# Altium schematic sheet S_Band.SchDoc
size A2; SheetNumber: 9; SheetTotal: 11
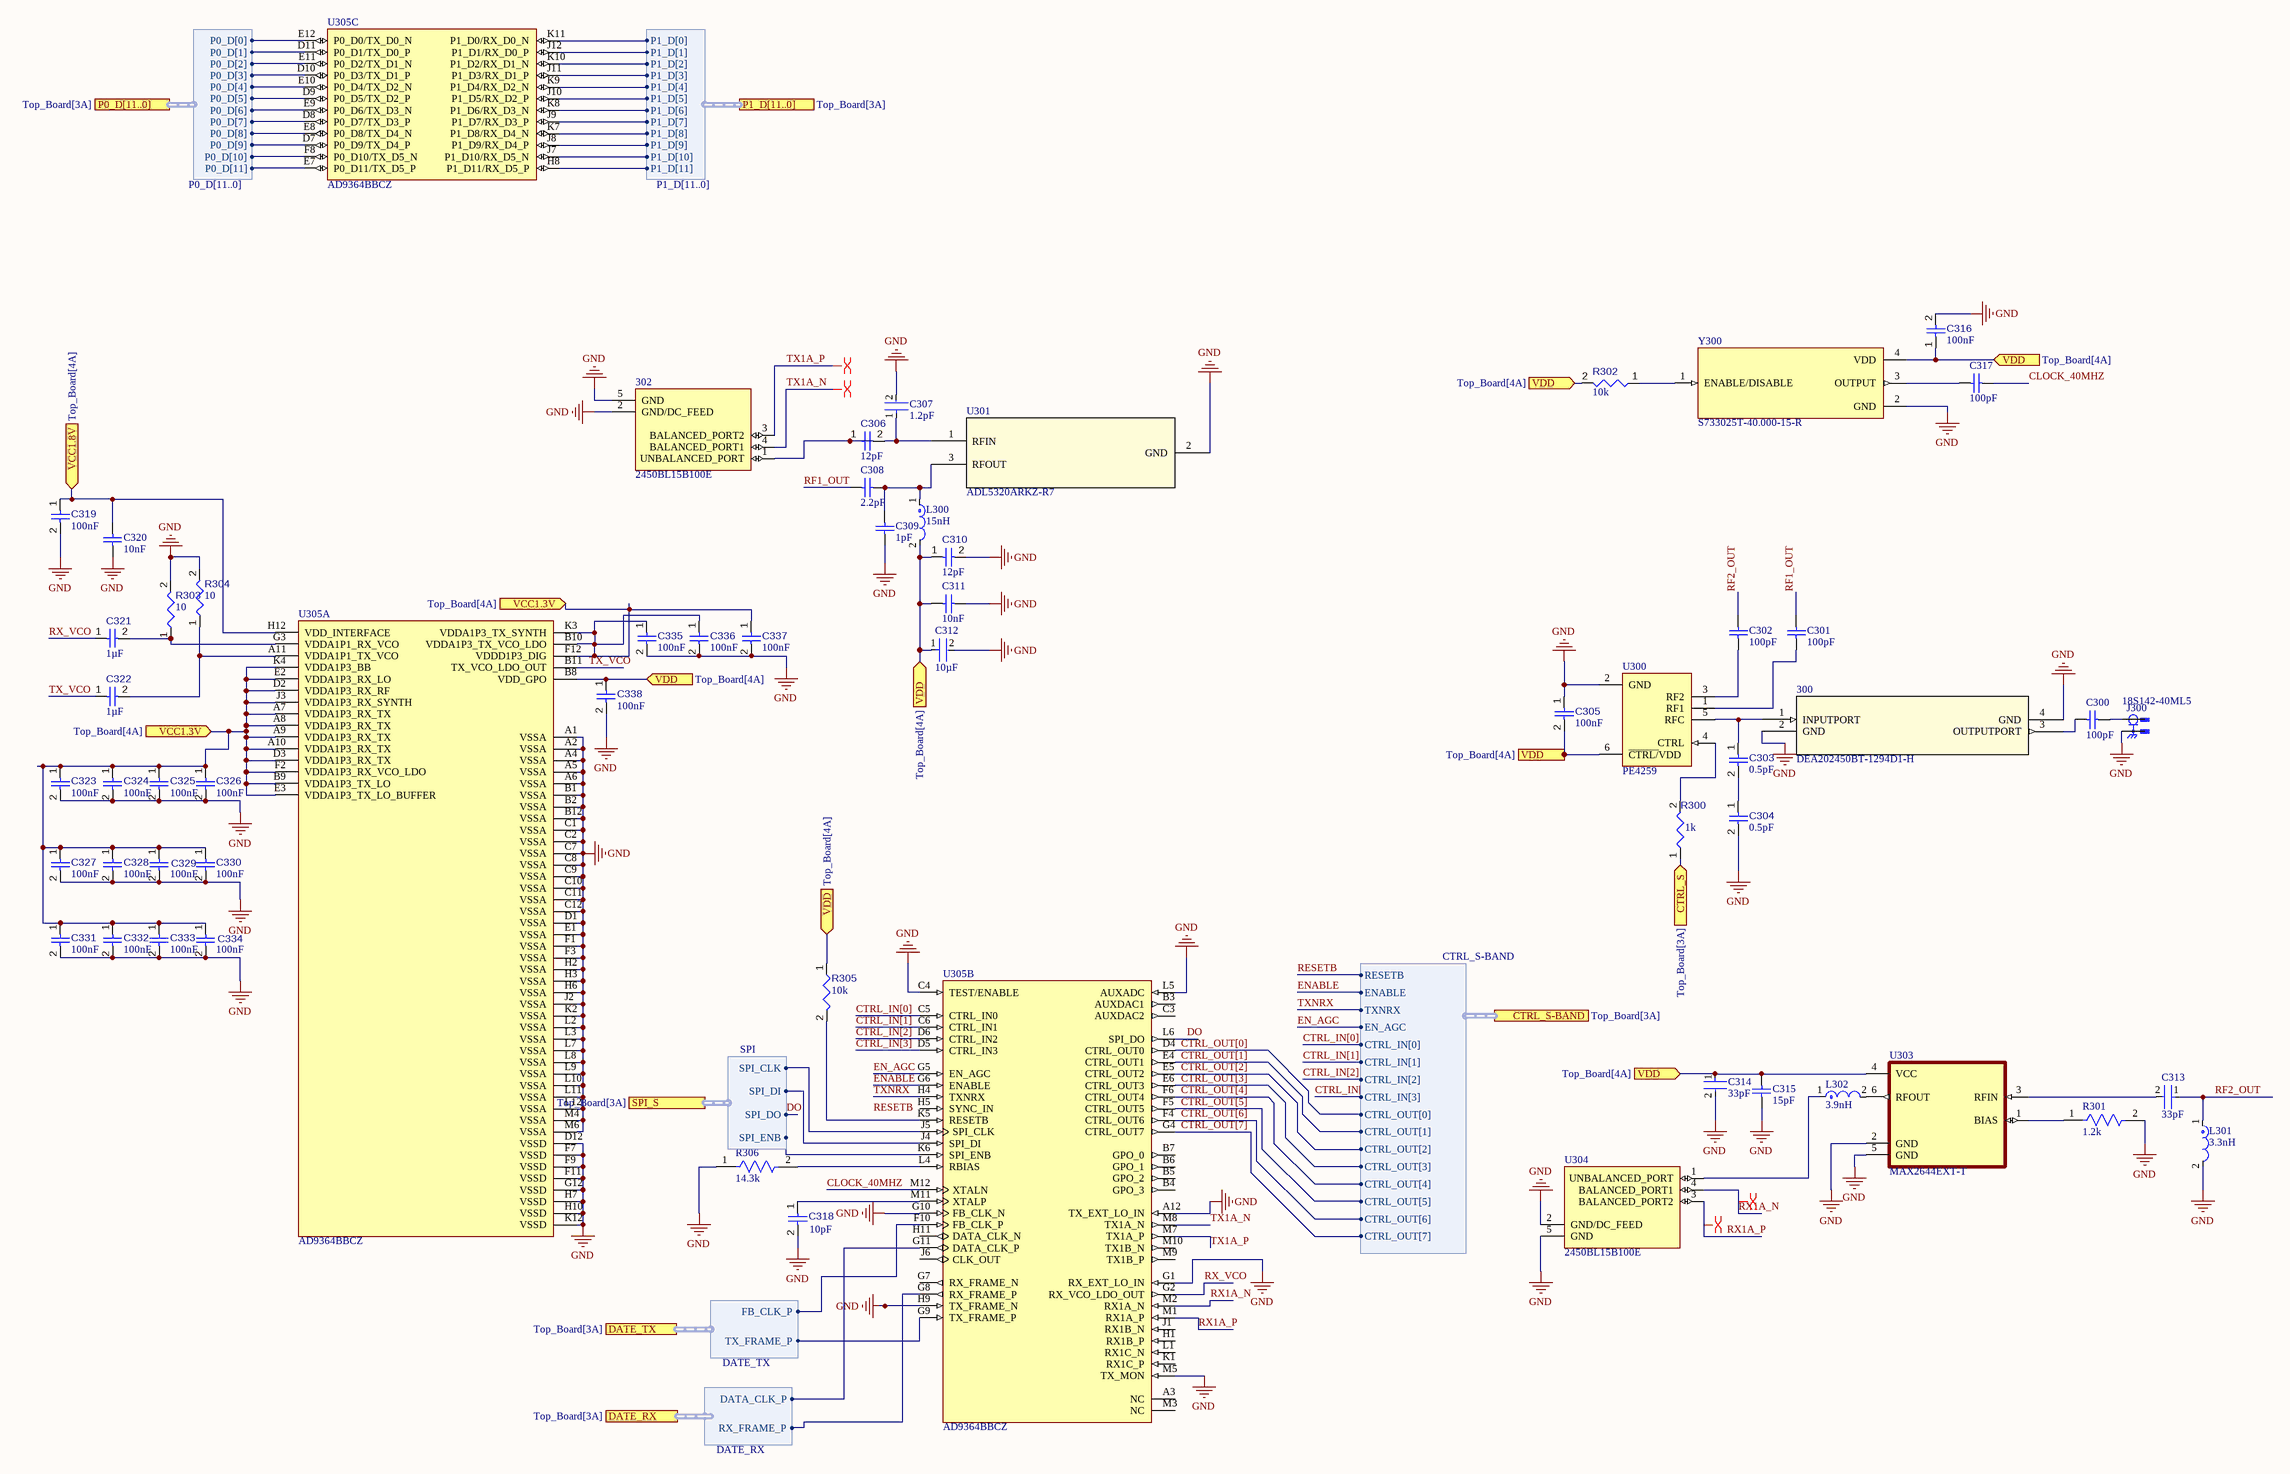
[diagram p0: S_Band.SchDoc]

## Parts
300  DEA202450BT-1294D1-H  [SMD4_DEA202450BT-0805_TDK]
302  2450BL15B100E  [BALUN_2450BL15B100E]
C300  value 100pF  [CAPC1608X92X38LL15T08]  (hidden comment: cap 100pF 0603)
C301  value 100pF  [CAPC1005X60X26ML10T16]  (hidden comment: cap 100p)
C302  value 100pF  [CAPC1005X60X26ML10T16]  (hidden comment: cap 100p)
C303  value 0.5pF  [CAPC1005X56X25ML10T15]  (hidden comment: Capacitor 0.5 pF +/- 0.1pF 25 V 0402)
C304  value 0.5pF  [CAPC1005X56X25ML10T15]  (hidden comment: Capacitor 0.5 pF +/- 0.1pF 25 V 0402)
C305  value 100nF  [CAPC0402(1005)60_L]  (hidden comment: Capacitor 100nF +/-20% 50V 0402)
C306  value 12pF  [CAPC0402(1005)33_L]  (hidden comment: Capacitor 12pF +/-10% 50V 0402)
C307  value 1.2pF  [FP-C0603C-CF-IPC_B]  (hidden comment: cap 1.2pF 0603)
C308  value 2.2pF  [CAPC0603(1608)100_N]  (hidden comment: cap 2.2pF 0603)
C309  value 1pF  [CAPC1608X92X38LL15T08]  (hidden comment: cap 1pF 0603)
C310  value 12pF  [CAPC0402(1005)33_L]  (hidden comment: Capacitor 12pF +/-10% 50V 0402)
C311  value 10nF  [CAPC1608X92X38LL15T08]  (hidden comment: cap 10nF 0603)
C312  value 10µF  [FP-CC0603-DC-IPC_B]  (hidden comment: cap 10uF 0603)
C313  value 33pF  [FP-C0603C-CF-IPC_B]  (hidden comment: cap 33pF 0603)
C314  value 33pF  [FP-C0603C-CF-IPC_B]  (hidden comment: cap 33pF 0603)
C315  value 15pF  [CAPC1608X92X38LL15T08]  (hidden comment: cap 15pF 0603)
C316  value 100nF  [CAPC2013X95X50LL10T25]  (hidden comment: Capacitor 100 nF +/-10% 50 V 0805)
C317  value 100pF  [CAPC1608X92X38LL15T08]  (hidden comment: cap 100pF 0603)
C318  value 10pF  [CAPC1608X90X40ML10T20]  (hidden comment: Capacitor 10 pF +/- 5% 50 V 0603)
C319  value 100nF  [CAPC1608X90X40NL10T20]  (hidden comment: Capacitor 100 nF +/-10% 50 V 0603)
C320  value 10nF  [CAPC1608X92X38LL15T08]  (hidden comment: cap 10nF 0603)
C321  value 1µF  [CAPC1608X90X35ML15T15]  (hidden comment: Capacitor 1uF +/- 10% 16V 0603)
C322  value 1µF  [CAPC1608X90X35ML15T15]  (hidden comment: Capacitor 1uF +/- 10% 16V 0603)
C323  value 100nF  [CAPC1608X90X40NL10T20]  (hidden comment: Capacitor 100 nF +/-10% 50 V 0603)
C324  value 100nF  [CAPC1608X90X40NL10T20]  (hidden comment: Capacitor 100 nF +/-10% 50 V 0603)
C325  value 100nF  [CAPC1608X90X40NL10T20]  (hidden comment: Capacitor 100 nF +/-10% 50 V 0603)
C326  value 100nF  [CAPC1608X90X40NL10T20]  (hidden comment: Capacitor 100 nF +/-10% 50 V 0603)
C327  value 100nF  [CAPC1608X90X40NL10T20]  (hidden comment: Capacitor 100 nF +/-10% 50 V 0603)
C328  value 100nF  [CAPC1608X90X40NL10T20]  (hidden comment: Capacitor 100 nF +/-10% 50 V 0603)
C329  value 100nF  [CAPC1608X90X40NL10T20]  (hidden comment: Capacitor 100 nF +/-10% 50 V 0603)
C330  value 100nF  [CAPC1608X90X40NL10T20]  (hidden comment: Capacitor 100 nF +/-10% 50 V 0603)
C331  value 100nF  [CAPC1608X90X40NL10T20]  (hidden comment: Capacitor 100 nF +/-10% 50 V 0603)
C332  value 100nF  [CAPC1608X90X40NL10T20]  (hidden comment: Capacitor 100 nF +/-10% 50 V 0603)
C333  value 100nF  [CAPC1608X90X40NL10T20]  (hidden comment: Capacitor 100 nF +/-10% 50 V 0603)
C334  value 100nF  [CAPC1608X90X40NL10T20]  (hidden comment: Capacitor 100 nF +/-10% 50 V 0603)
C335  value 100nF  [CAPC1608X90X40NL10T20]  (hidden comment: Capacitor 100 nF +/-10% 50 V 0603)
C336  value 100nF  [CAPC1608X90X40NL10T20]  (hidden comment: Capacitor 100 nF +/-10% 50 V 0603)
C337  value 100nF  [CAPC1608X90X40NL10T20]  (hidden comment: Capacitor 100 nF +/-10% 50 V 0603)
C338  value 100nF  [CAPC1608X90X40NL10T20]  (hidden comment: Capacitor 100 nF +/-10% 50 V 0603)
J300  18S142-40ML5  [ROSENBERGER_18S142-40ML5]
L300  value 15nH  [FP-LQP03TG_02-IPC_C]  (hidden comment: ind 15nH 0201)
L301  value 3.3nH  [FP-LQG18HH_00-IPC_A]  (hidden comment: ind 3.3nH 0603)
L302  value 3.9nH  [FP-LQG18HH_00-IPC_A]  (hidden comment: ind 3.9nH 0603)
R300  value 1k  [RESC0805(2012)_L]  (hidden comment: Resistor 1K +/-5% 0805 125 mW)
R301  value 1.2k  [FP-SR0805-MFG]  (hidden comment: res 1.2k 0805)
R302  value 10k  [RESC2013X50X35ML15T15]  (hidden comment: Resistor 10k +/-1% 0805 125 mW)
R303  value 10  [RESC0402(1005)_L]  (hidden comment: 10R2F)
R304  value 10  [RESC0402(1005)_L]  (hidden comment: 10R2F)
R305  value 10k  [RESC1608X55X25ML10T15]  (hidden comment: Resistor 10k +/-1% 0603 100 mW)
R306  value 14.3k  [FP-RT0603-IPC_C]  (hidden comment: res 14.3k 0603)
U300  PE4259  [SOT65P215X110-6N]
U301  ADL5320ARKZ-R7  [RK_3_ADI]
U303  MAX2644EXT-T  [SOT65P217X110-6N]
U304  2450BL15B100E  [BALUN_2450BL15B100E]
U305  AD9364BBCZ  [BGA144C80P12X12_1000X1000X170N]  (parts A,B,C of 3)
Y300  S733025T-40.000-15-R  [OSC_S733025T-40.000-15-R]

## Ports
CTRL_S (in, see Top_Board[3A]), CTRL_S-BAND (harness CTRL_S-BAND, see Top_Board[3A]), DATE_RX (harness DATE_RX, see Top_Board[3A]), DATE_TX (harness DATE_TX, see Top_Board[3A]), P0_D[11..0] (harness P0_D[11..0], see Top_Board[3A]), P1_D[11..0] (harness P1_D[11..0], see Top_Board[3A]), SPI_S (harness SPI, see Top_Board[3A]), VCC1.3V (in, see Top_Board[4A]), VCC1.8V (in, see Top_Board[4A]), VDD (in, see Top_Board[4A])

## Harnesses
SPI: SPI_CLK, SPI_DI, SPI_DO, SPI_ENB
CTRL_S-BAND: RESETB, ENABLE, TXNRX, EN_AGC, CTRL_IN[0], CTRL_IN[1], CTRL_IN[2], CTRL_IN[3], CTRL_OUT[0], CTRL_OUT[1], CTRL_OUT[2], CTRL_OUT[3], CTRL_OUT[4], CTRL_OUT[5], CTRL_OUT[7], CTRL_OUT[6]
DATE_TX: FB_CLK_P, TX_FRAME_P
DATE_RX: DATA_CLK_P, RX_FRAME_P
P0_D[11..0]: P0_D[0], P0_D[1], P0_D[2], P0_D[3], P0_D[4], P0_D[5], P0_D[6], P0_D[7], P0_D[8], P0_D[9], P0_D[10], P0_D[11]
P1_D[11..0]: P1_D[0], P1_D[2], P1_D[3], P1_D[4], P1_D[5], P1_D[6], P1_D[7], P1_D[8], P1_D[9], P1_D[10], P1_D[1], P1_D[11]

## Nets
GND: 300.2(GND) 300.4(GND) 302.2(GND/DC_FEED) 302.5(GND) C304.2 C305.1 C307.2 C309.2 C310.2 C311.2 C312.2 C314.2 C315.1 C316.2 C318.2 C319.2 C320.2 C323.2 C324.2 C325.2 C326.2 C327.2 C328.2 C329.2 C330.2 C331.2 C332.2 C333.2 C334.2 C335.2 C336.2 C337.2 C338.2 J300.G1 L301.2 R301.2 R303.2 R304.2 R306.1 U300.2(GND) U301.2(GND) U303.2(GND) U303.5(GND) U304.2(GND/DC_FEED) U304.5(GND) U305.A1(VSSA) U305.A2(VSSA) U305.A4(VSSA) U305.A5(VSSA) U305.A6(VSSA) U305.A12(TX_EXT_LO_IN) U305.B1(VSSA) U305.B2(VSSA) U305.B12(VSSA) U305.C1(VSSA) U305.C2(VSSA) U305.C4(TEST/ENABLE) U305.C7(VSSA) U305.C8(VSSA) U305.C9(VSSA) U305.C10(VSSA) U305.C11(VSSA) U305.C12(VSSA) U305.D1(VSSA) U305.D12(VSSD) U305.E1(VSSA) U305.F1(VSSA) U305.F3(VSSA) U305.F7(VSSD) U305.F9(VSSD) U305.F11(VSSD) U305.G1(RX_EXT_LO_IN) U305.G10(FB_CLK_N) U305.G12(VSSD) U305.H2(VSSA) U305.H3(VSSA) U305.H6(VSSA) U305.H7(VSSD) U305.H9(TX_FRAME_N) U305.H10(VSSD) U305.J2(VSSA) U305.K2(VSSA) U305.K12(VSSD) U305.L2(VSSA) U305.L3(VSSA) U305.L5(AUXADC) U305.L7(VSSA) U305.L8(VSSA) U305.L9(VSSA) U305.L10(VSSA) U305.L11(VSSA) U305.L12(VSSA) U305.M4(VSSA) U305.M5(TX_MON) U305.M6(VSSA) Y300.2(GND)
CLOCK_40MHZ: C317.2 U305.M12(XTALN)
CTRL_IN[0]: U305.C5(CTRL_IN0) ; port CTRL_S-BAND.CTRL_IN[0]
CTRL_IN[1]: U305.C6(CTRL_IN1) ; port CTRL_S-BAND.CTRL_IN[1]
CTRL_IN[2]: U305.D6(CTRL_IN2) ; port CTRL_S-BAND.CTRL_IN[2]
CTRL_IN[3]: U305.D5(CTRL_IN3) ; port CTRL_S-BAND.CTRL_IN[3]
CTRL_OUT[0]: U305.D4(CTRL_OUT0) ; port CTRL_S-BAND.CTRL_OUT[0]
CTRL_OUT[1]: U305.E4(CTRL_OUT1) ; port CTRL_S-BAND.CTRL_OUT[1]
CTRL_OUT[2]: U305.E5(CTRL_OUT2) ; port CTRL_S-BAND.CTRL_OUT[2]
CTRL_OUT[3]: U305.E6(CTRL_OUT3) ; port CTRL_S-BAND.CTRL_OUT[3]
CTRL_OUT[4]: U305.F6(CTRL_OUT4) ; port CTRL_S-BAND.CTRL_OUT[4]
CTRL_OUT[5]: U305.F5(CTRL_OUT5) ; port CTRL_S-BAND.CTRL_OUT[5]
CTRL_OUT[6]: U305.F4(CTRL_OUT6) ; port CTRL_S-BAND.CTRL_OUT[6]
CTRL_OUT[7]: U305.G4(CTRL_OUT7) ; port CTRL_S-BAND.CTRL_OUT[7]
CTRL_S: R300.1 ; port CTRL_S
DO: U305.L6(SPI_DO) ; port SPI_S.SPI_DO
EN_AGC: U305.G5(EN_AGC) ; port CTRL_S-BAND.EN_AGC
ENABLE: U305.G6(ENABLE) ; port CTRL_S-BAND.ENABLE
RESETB: port CTRL_S-BAND.RESETB
RF1_OUT: C301.1 C308.1
RF2_OUT: C302.1 C313.1 L301.1
RX1A_N: U304.4(BALANCED_PORT1) U305.M2(RX1A_N)
RX1A_P: U304.3(BALANCED_PORT2) U305.M1(RX1A_P)
RX_VCO: C321.1 U305.G2(RX_VCO_LDO_OUT)
TX1A_N: 302.4(BALANCED_PORT1) U305.M8(TX1A_N)
TX1A_P: 302.3(BALANCED_PORT2) U305.M7(TX1A_P)
TX_VCO: C322.1 U305.B11(TX_VCO_LDO_OUT)
TXNRX: U305.H4(TXNRX) ; port CTRL_S-BAND.TXNRX
VCC1.3V: C323.1 C324.1 C325.1 C326.1 C327.1 C328.1 C329.1 C330.1 C331.1 C332.1 C333.1 C334.1 C335.1 C336.1 C337.1 U305.A7(VDDA1P3_RX_TX) U305.A8(VDDA1P3_RX_TX) U305.A9(VDDA1P3_RX_TX) U305.A10(VDDA1P3_RX_TX) U305.B9(VDDA1P3_TX_LO) U305.B10(VDDA1P3_TX_VCO_LDO) U305.D2(VDDA1P3_RX_RF) U305.D3(VDDA1P3_RX_TX) U305.E2(VDDA1P3_RX_LO) U305.E3(VDDA1P3_TX_LO_BUFFER) U305.F2(VDDA1P3_RX_VCO_LDO) U305.F12(VDDD1P3_DIG) U305.J3(VDDA1P3_RX_SYNTH) U305.K3(VDDA1P3_TX_SYNTH) U305.K4(VDDA1P3_BB) ; port VCC1.3V
VCC1.8V: C319.1 C320.1 U305.H12(VDD_INTERFACE) ; port VCC1.8V
VDD: C305.2 C310.1 C311.1 C312.1 C314.1 C315.2 C316.1 C338.1 L300.2 R302.2 R305.1 U300.6(~{CTRL/}VDD) U303.4(VCC) U305.B8(VDD_GPO) Y300.4(VDD) ; port VDD
Net300_1: 300.1(INPUTPORT) C303.1 U300.5(RFC)
Net300_3: 300.3(OUTPUTPORT) C300.1
Net302_1: 302.1(UNBALANCED_PORT) C306.1
NetC300_2: C300.2 J300.1
NetC301_2: C301.2 U300.1(RF1)
NetC302_2: C302.2 U300.3(RF2)
NetC303_2: C303.2 C304.1
NetC306_2: C306.2 C307.1 U301.1(RFIN)
NetC308_2: C308.2 C309.1 L300.1 U301.3(RFOUT)
NetC313_2: C313.2 U303.3(RFIN)
NetC317_1: C317.1 Y300.3(OUTPUT)
NetC318_1: C318.1 U305.M11(XTALP)
NetC321_2: C321.2 R303.1 U305.G3(VDDA1P1_RX_VCO)
NetC322_2: C322.2 R304.1 U305.A11(VDDA1P1_TX_VCO)
NetL302_1: L302.1 U304.1(UNBALANCED_PORT)
NetL302_2: L302.2 U303.6(RFOUT)
NetR300_2: R300.2 U300.4(CTRL)
NetR301_1: R301.1 U303.1(BIAS)
NetR302_1: R302.1 Y300.1(ENABLE/DISABLE)
NetR305_2: R305.2 U305.K5(RESETB)
NetR306_2: R306.2 U305.L4(RBIAS)
NetU305_D7: U305.D7(P0_D9/TX_D4_P) ; port P0_D[11..0].P0_D[9]
NetU305_D8: U305.D8(P0_D7/TX_D3_P) ; port P0_D[11..0].P0_D[7]
NetU305_D9: U305.D9(P0_D5/TX_D2_P) ; port P0_D[11..0].P0_D[5]
NetU305_D10: U305.D10(P0_D3/TX_D1_P) ; port P0_D[11..0].P0_D[3]
NetU305_D11: U305.D11(P0_D1/TX_D0_P) ; port P0_D[11..0].P0_D[1]
NetU305_E7: U305.E7(P0_D11/TX_D5_P) ; port P0_D[11..0].P0_D[11]
NetU305_E8: U305.E8(P0_D8/TX_D4_N) ; port P0_D[11..0].P0_D[8]
NetU305_E9: U305.E9(P0_D6/TX_D3_N) ; port P0_D[11..0].P0_D[6]
NetU305_E10: U305.E10(P0_D4/TX_D2_N) ; port P0_D[11..0].P0_D[4]
NetU305_E11: U305.E11(P0_D2/TX_D1_N) ; port P0_D[11..0].P0_D[2]
NetU305_E12: U305.E12(P0_D0/TX_D0_N) ; port P0_D[11..0].P0_D[0]
NetU305_F8: U305.F8(P0_D10/TX_D5_N) ; port P0_D[11..0].P0_D[10]
NetU305_F10: U305.F10(FB_CLK_P) ; port DATE_TX.FB_CLK_P
NetU305_G8: U305.G8(RX_FRAME_P) ; port DATE_RX.RX_FRAME_P
NetU305_G9: U305.G9(TX_FRAME_P) ; port DATE_TX.TX_FRAME_P
NetU305_G11: U305.G11(DATA_CLK_P) ; port DATE_RX.DATA_CLK_P
NetU305_H8: U305.H8(P1_D11/RX_D5_P) ; port P1_D[11..0].P1_D[11]
NetU305_J4: U305.J4(SPI_DI) ; port SPI_S.SPI_DI
NetU305_J5: U305.J5(SPI_CLK) ; port SPI_S.SPI_CLK
NetU305_J7: U305.J7(P1_D10/RX_D5_N) ; port P1_D[11..0].P1_D[10]
NetU305_J8: U305.J8(P1_D9/RX_D4_P) ; port P1_D[11..0].P1_D[9]
NetU305_J9: U305.J9(P1_D7/RX_D3_P) ; port P1_D[11..0].P1_D[7]
NetU305_J10: U305.J10(P1_D5/RX_D2_P) ; port P1_D[11..0].P1_D[5]
NetU305_J11: U305.J11(P1_D3/RX_D1_P) ; port P1_D[11..0].P1_D[3]
NetU305_J12: U305.J12(P1_D1/RX_D0_P) ; port P1_D[11..0].P1_D[1]
NetU305_K6: U305.K6(SPI_ENB) ; port SPI_S.SPI_ENB
NetU305_K7: U305.K7(P1_D8/RX_D4_N) ; port P1_D[11..0].P1_D[8]
NetU305_K8: U305.K8(P1_D6/RX_D3_N) ; port P1_D[11..0].P1_D[6]
NetU305_K9: U305.K9(P1_D4/RX_D2_N) ; port P1_D[11..0].P1_D[4]
NetU305_K10: U305.K10(P1_D2/RX_D1_N) ; port P1_D[11..0].P1_D[2]
NetU305_K11: U305.K11(P1_D0/RX_D0_N) ; port P1_D[11..0].P1_D[0]

Not connected (* = marked no-connect by the designer): U305 A3(NC) B3(AUXDAC1) B4(GPO_3) B5(GPO_2) B6(GPO_1) B7(GPO_0) C3(AUXDAC2) G7(RX_FRAME_N) H1(RX1B_P) H5(SYNC_IN) H11(DATA_CLK_N) J1(RX1B_N) J6(CLK_OUT) K1(RX1C_P) L1(RX1C_N) M3(NC) M9(TX1B_P) M10(TX1B_N)

## Layout directives
differential pair: RX1A_N, RX1A_P, TX1A_N, TX1A_P

## Notes on the sheet
- Labels drawn without touching a wire or pin: RESETB

## Library data of the parts
300 = DEA202450BT-1294D1-H: No Description Available; Manufacturer_Name: TDK; Type: RF Filters; Copyright: Copyright (C) 2026 Ultra Librarian. All rights reserved.; Manufacturer_Part_Number: DEA202450BT-1294D1-H; RefDes: RefDes
302 U304 = CMP-048-000000-1: RF Balun 2.4GHz ~ 2.5GHz 50 / 100Ohm 0805 (2012 Metric); MF: Johanson Technology; Digi-Key_Part_Number: 712-1041-1-ND; MP: 2450BL15B100E; Design Item ID: 2450BL15B100E; Source: 2450BL15B100E.SchLib; SnapEDA_Link: https://www.snapeda.com/parts/2450BL15B100E/Johanson%20Technology%20Inc./view-part/512836/?ref=snap; Package: 0805 Johanson; Purchase-URL: https://pricing.snapeda.com/search/part/2450BL15B100E/?ref=eda; Component Type: Standard; Value: *; Pin Count: 5; Check_prices: https://www.snapeda.com/parts/2450BL15B100E/Johanson%20Technology%20Inc./view-part/512836/?ref=eda
C300 C317 = CMP-001-00098-1: Ceramic Capacitor, Multilayer, Ceramic, 100V, 10% +Tol, 10% -Tol, C0G, 30ppm/Cel TC, 0.0001uF, Surface Mount, 0603; RoHS: Compliant; China RoHS: Compliant; Case/Package: 0603; Mounting Technology: Surface Mount; Max Operating Temperature: 150°C; Dielectric Material: Ceramic; Number of Terminals: 2; Export Control Classification Number (ECCN) Code: EAR99; Country of Origin: Israel; Harmonized Tariff Schedule (HTS) Code: 8532.24.00.20; Min Operating Temperature: -55°C; Case Code (Metric): 1608; Tolerance: 10%; Termination: SMD/SMT; Lifecycle Status: Production; Voltage Rating (DC): 100V; Depth: 800µm; Length: 1.6mm; Width: 800µm; Dielectric: C0G; Height: 970µm; Case Code (Imperial): 0603; Introduction Date: 1999-11-09; REACH SVHC: Unaffected
C301 C302 = CMP-001-00096-1: Ceramic Capacitor, Multilayer, Ceramic, 50V, 1% +Tol, 1% -Tol, C0G, 30ppm/Cel TC, 0.0001uF, Surface Mount, 0402; Packaging: Tape and Reel; Height: 600µm; Min Operating Temperature: -55°C; Max Operating Temperature: 150°C; China RoHS: Compliant; Width: 500µm; Case/Package: 0402; Depth: 500µm; REACH SVHC: Unaffected; Lifecycle Status: Production; Voltage Rating (DC): 50V; Mounting Technology: Surface Mount; Tolerance: 1%; Dielectric: C0G; Dielectric Material: Ceramic; Number of Terminals: 2; Length: 1mm; RoHS: Compliant
C303 C304 = CMP-001-00002-6: Chip Capacitor, 0.5 pF, +/- 0.1pF, 25 V, 0402 (1005 Metric); Voltage Rating: 25V; Tolerance: 20%; Capacitor Type: Ceramic; Max Operating Temperature: 125°C; Case/Package: 0402; Pins: 2; RoHS Compliant: True; Min Operating Temperature: -55°C; Mounting Technology: SM
C305 = CMP-001-00067-3: Chip Capacitor, 100nF +/-20%, 50V, 0402, Thickness 0.6 mm; Tolerance: 10%; Min Operating Temperature: -55°C; Pins: 2; Case/Package: 0402; Max Operating Temperature: 85°C; Voltage Rating: 50V; Mounting Technology: SMT
C306 C310 = CMP-001-00072-4: Chip Capacitor, 12pF +/-10%, 50V, 0402, Thickness 0.33 mm; Tolerance: 20%; Pins: 2; Max Operating Temperature: 85°C; Case/Package: 0402; Voltage Rating: 50V; Mounting Technology: SMT; Min Operating Temperature: -55°C
C307 = CMP-001-00105-1: Cap Ceramic 1.2pF 50V C0G 0.5pF SMD 0603 125°C Paper T/R; Temperature Coefficient: 30ppm/°C; Dissipation Factor: 0.1%; Case Code (Imperial): 0603; Voltage Rating: 50V; RoHS: Compliant; Lead Pitch: 700µm; Country of Origin: Mexico; REACH SVHC: Unaffected; Lifecycle Status: Production; Introduction Date: 2008-06-06; Number of Terminals: 2; Lead Free: Lead Free; Min Operating Temperature: -55°C; Voltage Rating (DC): 50V; Material: Ceramic; Case Code (Metric): 1608; Depth: 800µm; Termination: SMD/SMT; China RoHS: Compliant; Case/Package: 0603; Dielectric Material: Ceramic; Dielectric: C0G; Mounting Technology: Surface Mount; Length: 1.6mm; Max Operating Temperature: 125°C; Harmonized Tariff Schedule (HTS) Code: 8532.24.00.20; Width: 800µm; Height: 800µm; Contact Material: Tin; Thickness: 863.6µm; Export Control Classification Number (ECCN) Code: EAR99
C308 = CMP-001-00104-1: Ceramic Capacitor, Multilayer, Ceramic, 16V, 0% +Tol, 0% -Tol, C0G, 30ppm/Cel TC, 0.0000022uF, Surface Mount, 0603; Case Code (Imperial): 0603; China RoHS: Compliant; Min Operating Temperature: -55°C; Case Code (Metric): 1608; Dielectric Material: Ceramic; Case/Package: 0603; Width: 800µm; RoHS: Compliant; Dielectric: C0G; Number of Terminals: 2; Length: 1.6mm; Max Operating Temperature: 125°C; Height: 870µm; Voltage Rating (DC): 16V; REACH SVHC: Unaffected; Export Control Classification Number (ECCN) Code: EAR99; Lifecycle Status: Production; Mounting Technology: Surface Mount; Termination: SMD/SMT; Depth: 800µm; Harmonized Tariff Schedule (HTS) Code: 8532.24.00.20
C309 = CMP-001-00106-1: Ceramic Capacitor, Multilayer, Ceramic, 50V, 10% +Tol, 10% -Tol, C0G, 30ppm/Cel TC, 1e-06uF, Surface Mount, 0603; Export Control Classification Number (ECCN) Code: EAR99; Lifecycle Status: Production; Height: 970µm; Dielectric: C0G; Max Operating Temperature: 150°C; Number of Terminals: 2; China RoHS: Compliant; Introduction Date: 2007-07-09; RoHS: Compliant; Depth: 800µm; Case Code (Imperial): 0603; Width: 800µm; Case/Package: 0603; Voltage Rating (DC): 50V; Harmonized Tariff Schedule (HTS) Code: 8532.24.00.20; Country of Origin: Israel; Termination: SMD/SMT; Length: 1.6mm; Case Code (Metric): 1608; REACH SVHC: Unaffected; Min Operating Temperature: -55°C; Mounting Technology: Surface Mount; Dielectric Material: Ceramic
C311 C320 = CMP-001-00099-1: Ceramic Capacitor, Multilayer, Ceramic, 50V, 10% +Tol, 10% -Tol, X7R, 15% TC, 0.01uF, Surface Mount, 0603; Lifecycle Status: Production; REACH SVHC: Unaffected; Depth: 800µm; Dielectric: X7R; China RoHS: Non-Compliant; Width: 800µm; Min Operating Temperature: -55°C; RoHS: Compliant; Max Operating Temperature: 150°C; Voltage Rating (DC): 50V; Length: 1.6mm; Height: 970µm; Tolerance: 10%; Case/Package: 0603; Mounting Technology: Surface Mount; Number of Terminals: 2; Dielectric Material: Ceramic
C312 = CMP-001-00100-1: 16V 10uF X5R ±10% 0603 Multilayer Ceramic Capacitors MLCC - SMD/SMT ROHS; Dielectric Material: Ceramic; Number of Terminals: 2; RoHS: Compliant; Export Control Classification Number (ECCN) Code: EAR99; REACH SVHC: Unaffected; Height: 800µm; Introduction Date: 2014-07-08; Mounting Technology: Surface Mount; Tolerance: 10%; Length: 1.6mm; Country of Origin: Mainland China, Taiwan; Halogen Free: Halogen Free; Voltage Rating: 16V; Harmonized Tariff Schedule (HTS) Code: 8532.24.00.20; China RoHS: Compliant; Min Operating Temperature: -55°C; Lifecycle Status: Production; Lead Free: Lead Free; Material: Ceramic; Dielectric: X5R; Max Operating Temperature: 85°C; Voltage Rating (DC): 16V; Case/Package: 0603; Width: 800µm
C313 C314 = CMP-001-00103-1: Ceramic Capacitor, Multilayer, Ceramic, 50V, 20% +Tol, 20% -Tol, X8R, 15% TC, 3.3e-05uF, Surface Mount, 0603; Temperature Coefficient: 30ppm/°C; Min Operating Temperature: -55°C; Dielectric Material: Ceramic; RoHS: Compliant; Mounting Technology: Surface Mount; Lifecycle Status: Production; Lead Free: Lead Free; Number of Terminals: 2; China RoHS: Compliant; Width: 800µm; Length: 1.6mm; Country of Origin: Mexico; Voltage Rating: 50V; REACH SVHC: Unaffected; Material: Ceramic; Harmonized Tariff Schedule (HTS) Code: 8532.24.00.20; Introduction Date: 2017-10-02; Export Control Classification Number (ECCN) Code: EAR99; Max Operating Temperature: 150°C; Case/Package: 0603; Voltage Rating (DC): 50V; Height: 800µm; Dielectric: X8R
C315 = CMP-001-00107-1: VJ 0603 (1608Metric) Ceramic Capacitor 0.063Lx0.031W 1.60mmx0.80mm C0G NP0 ±10% 15pF; Voltage Rating (DC): 50V; Mounting Technology: Surface Mount; Case Code (Imperial): 0603; REACH SVHC: Unaffected; Depth: 800µm; Dielectric Material: Ceramic; Lifecycle Status: Production; Number of Terminals: 2; Length: 1.6mm; Max Operating Temperature: 150°C; Termination: SMD/SMT; China RoHS: Compliant; Width: 800µm; Tolerance: 10%; Height: 970µm; Min Operating Temperature: -55°C; Radiation Hardening: No; RoHS: Compliant; Case Code (Metric): 1608; Dielectric: C0G; Case/Package: 0603
C316 = CMP-001-00018-6: Chip Capacitor, 100 nF, +/- 10%, 50 V, 0805 (2012 Metric); Capacitor Type: Ceramic; Voltage Rating: 50V; Pins: 2; Max Operating Temperature: 125°C; Min Operating Temperature: -55°C; Mounting Technology: SM; Case/Package: 0805; RoHS Compliant: True; Tolerance: 10%
C318 = CMP-001-00014-6: Chip Capacitor, 10 pF, +/- 5%, 50 V, 0603 (1608 Metric); Capacitor Type: Ceramic; Voltage Rating: 50V; RoHS Compliant: True; Case/Package: 0603; Max Operating Temperature: 125°C; Pins: 2; Tolerance: 5%; Mounting Technology: SM; Min Operating Temperature: -55°C
C319 C323-C338 = CMP-001-00017-6: Chip Capacitor, 100 nF, +/- 10%, 50 V, 0603 (1608 Metric); Voltage Rating: 50V; Capacitor Type: Ceramic; Tolerance: 10%; Mounting Technology: SM; Max Operating Temperature: 125°C; RoHS Compliant: True; Pins: 2; Case/Package: 0603; Min Operating Temperature: -55°C
C321 C322 = CMP-001-00004-6: Chip Capacitor, 1 uF, +/- 10%, 16 V, 0603 (1608 Metric); Capacitor Type: Ceramic; Mounting Technology: SM; RoHS Compliant: True; Min Operating Temperature: -55°C; Case/Package: 0603; Pins: 2; Voltage Rating: 16V; Max Operating Temperature: 125°C; Tolerance: 10%
J300 = CMP-002-00075-1: SMP, Mini Connector Plug, Male Pin 50 Ohms Surface Mount Solder; MF: Rosenberger; Case/Package: None; Source: 18S142-40ML5.SchLib; Design Item ID: 18S142-40ML5; MP: 18S142-40ML5; Check_prices: https://www.snapeda.com/parts/18S142-40ML5/Rosenberger/view-part/?ref=eda; Pins: 2; Component Type: Standard; SnapEDA_Link: https://www.snapeda.com/parts/18S142-40ML5/Rosenberger/view-part/?ref=snap; Value: *; Component Type: Connectors
L300 = CMP-006-00023-1: Inductor RF Chip Thin Film 15nH 3% 500MHz 12Q-Factor 250mA 700mOhm DCR 0201 Paper T/R; Manufacturer Lifecycle Status: IN PRODUCTION; Manufacturer Package Identifier: 0805 (2012 metric); Self Resonant Frequency: 2.6GHz; ESR: 700mΩ; Q Factor: 12; Shielding: Unshielded; Number of Circuits: 1; Core Material: Non-Magnetic; Case/Package: 0201; Height - Seated (Max): 330.2µm; Termination: SMD/SMT; DC Current: 250mA; Min Operating Temperature: -55°C; Height: 300µm; Military Standard: Not; Width: 300µm; Max Operating Temperature: 125°C; Mounting Technology: Surface Mount; RoHS: Compliant; Depth: 330µm; Radiation Hardening: No; Test Frequency: 500MHz; REACH SVHC: Unaffected; RMS Current (Irms): 250mA; Case Code (Metric): 0603; Composition: Thin Film; DC Resistance (DCR): 700mΩ; Number of Terminals: 2; Tolerance: 3%; Case Code (Imperial): 0201; Max Current Rating: 250mA; Max DC Current: 250mA; Length: 600µm; Lifecycle Status: Production; Schedule B: 8504500000, 8504500000; Packaging: Tape & Reel (TR); Current Rating: 250mA
L301 = CMP-006-00025-1: General Purpose Inductor, 0.0033uH, 9.0909%, 1 Element, Reflow soldering, 1608/0603; Manufacturer Lifecycle Status: IN PRODUCTION; Q Factor: 12; Self Resonant Frequency: 4GHz; Core Material: Air; Max Current Rating: 900mA; Tolerance: 9.09%; ESR: 140mΩ; Shielding: Unshielded; Test Frequency: 100MHz; Number of Circuits: 1; Number of Terminals: 2; Case/Package: 0603; Lifecycle Status: Production; Height: 800µm; Min Operating Temperature: -55°C; Ratings: AEC-Q200; Width: 800µm; REACH SVHC: Unaffected; Termination: SMD/SMT; RoHS: Compliant; Current Rating: 900mA; Max Operating Temperature: 125°C; Length: 1.6mm; RMS Current (Irms): 900mA; DC Resistance (DCR): 140mΩ
L302 = CMP-006-00026-1: General Purpose Inductor, 0.0039uH, 7.6923%, 1 Element, Reflow soldering, 1608/0603; Manufacturer Lifecycle Status: IN PRODUCTION; DC Resistance (DCR): 150mΩ; Max Current Rating: 900mA; Q Factor: 12; Number of Circuits: 1; Test Frequency: 100MHz; Core Material: Air; Shielding: Unshielded; Tolerance: 7.69%; Self Resonant Frequency: 3GHz; Lifecycle Status: Production; RoHS: Compliant; ESR: 150mΩ; Number of Terminals: 2; Height: 800µm; RMS Current (Irms): 900mA; Ratings: AEC-Q200; Current Rating: 900mA; Min Operating Temperature: -55°C; Case/Package: 0603; Termination: SMD/SMT; Schedule B: 8504500000, 8504500000; REACH SVHC: Unaffected; Max Operating Temperature: 125°C; Width: 800µm; Length: 1.6mm
R300 = CMP-009-00118-3: Chip Resistor, 1 kOhms, +/-5%, 125 mW, -55 to 155 degC, 0805; Tolerance: 5%; Power: 125mW; Case/Package: 0805; Pins: 2; Min Operating Temperature: -55°C; Max Operating Temperature: 155°C
R301 = CMP-009-00199-1: Fixed Resistor, Metal Glaze/thick Film, 0.125W, 1200ohm, 500V, 1% +/-Tol, 100ppm/Cel, Surface Mount, 0805; Temperature Coefficient: 100ppm/°C; Voltage Rating: 150V; Power Rating: 125mW; Case/Package: 0805; Lifecycle Status: Production; Packaging: Tape & Reel; Working Voltage: 500V; Length: 2mm; Min Operating Temperature: -55°C; Tolerance: 1%; Introduction Date: 2017-10-02; Ratings: AEC-Q200; Height: 500µm; Export Control Classification Number (ECCN) Code: EAR99; Harmonized Tariff Schedule (HTS) Code: 8533.21.00.30; Composition: Thick Film; Number of Terminals: 2; RoHS: Compliant; Mounting Technology: Surface Mount; Max Operating Temperature: 155°C; REACH SVHC: Unaffected; China RoHS: Non-Compliant; Country of Origin: Mainland China, Taiwan; Width: 1.25mm
R302 = CMP-009-00018-5: Chip Resistor, 10 KOhm, +/- 1%, 125 mW, -55 to 155 degC, 0805 (2012 Metric); Power: 125mW; Voltage Rating: 150V; Tolerance: 1%; Pins: 2; Min Operating Temperature: -55°C; Case/Package: 0805; Max Operating Temperature: 155°C; RoHS Compliant: True; Mounting Technology: SM
R303 R304 = CMP-009-00067-2: 10R 0.063W 1% 0402 (1005 Metric)  SMD; Power: 63mW; Case/Package: 0402; Tolerance: 1%; Mounting Technology: SMT; Pins: 2
R305 = CMP-009-00017-5: Chip Resistor, 10 KOhm, +/- 1%, 01 W, -55 to 155 degC, 0603 (1608 Metric); Voltage Rating: 50V; Power: 100mW; RoHS Compliant: True; Min Operating Temperature: -55°C; Pins: 2; Case/Package: 0603; Mounting Technology: SM; Max Operating Temperature: 155°C; Tolerance: 1%
R306 = CMP-009-00200-1: Fixed Resistor, Thin Film, 0.1W, 14300ohm, 75V, 0.1% +/-Tol, 25ppm/Cel, Surface Mount, 0603; Temperature Coefficient: 25ppm/°C; Voltage Rating (DC): 50V; Power Rating: 100mW; Case/Package: 0603; Width: 800µm; Country of Origin: Mainland China, Taiwan; RoHS: Compliant; Mounting Technology: Surface Mount; Max Operating Temperature: 155°C; Tolerance: 0.1%; Height: 450µm; China RoHS: Non-Compliant; Introduction Date: 2008-06-09; Weight: 2.012816mg; Number of Terminations: 2; Case Code (Imperial): 0603; Min Operating Temperature: -55°C; Composition: Thin Film; Working Voltage: 75V; Voltage Rating: 75V; Termination: SMD/SMT; Export Control Classification Number (ECCN) Code: EAR99; Lifecycle Status: Production; Length: 1.6mm; REACH SVHC: Unaffected; Lead Free: Lead Free; Features: Moisture Resistant; Max Power Dissipation: 100mW; Harmonized Tariff Schedule (HTS) Code: 8533.21.00.30; Number of Terminals: 2
U300 = CMP-031-00008-1: RF Switch IC General Purpose SPDT 3 GHz 50Ohm SC-70-6; MF: pSemi; Pins: 6; Value: *; Check_prices: https://www.snapeda.com/parts/PE4259/pSemi/view-part/?ref=eda; Case/Package: SOT-363 Peregrine Semiconductor; SnapEDA_Link: https://www.snapeda.com/parts/PE4259/pSemi/view-part/?ref=snap; Source: PE4259.SchLib; MP: PE4259; Design Item ID: PE4259; Component Type: Standard
U301 = CMP-014-00006-1: 400 MHz TO 2700 MHz Â¼ Watt RF Driver Amplifier; Manufacturer_Name: Analog Devices Inc; Copyright: Copyright (C) 2026 Ultra Librarian. All rights reserved.; Source: ADL5320ARKZ-R7.SchLib; Type: Type; Design Item ID: ADL5320ARKZ-R7; RefDes: RefDes; Manufacturer_Part_Number: ADL5320ARKZ-R7
U303 = CMP-014-00005-1: 2.4GHz SiGe, High IP3 Low-Noise Amplifier; MF: Analog Devices; MP: MAX2644EXT+T; SnapEDA_Link: https://www.snapeda.com/parts/MAX2644EXT+T/Analog+Devices/view-part/?ref=snap; Source: MAX2644EXT-T.SchLib; Value: *; Check_prices: https://www.snapeda.com/parts/MAX2644EXT+T/Analog+Devices/view-part/?ref=eda; Case/Package: SC-70-6 Maxim; Design Item ID: MAX2644EXT-T; Component Type: Standard; Pins: 6
U305 = CMP-045-000000-1: 1 x 1 RF Agile Transceiver; MF: Analog Devices; Component Type: Standard; SnapEDA_Link: https://www.snapeda.com/parts/AD9364BBCZ/Analog+Devices/view-part/?ref=snap; Check_prices: https://www.snapeda.com/parts/AD9364BBCZ/Analog+Devices/view-part/?ref=eda; Pin Count: 144; Value: *; Package: CSPBGA -144 Analog Devices; Design Item ID: AD9364BBCZ; MP: AD9364BBCZ; Source: AD9364BBCZ.SchLib
Y300 = CMP-049-000000-1: Package: None; MP: S733025T-40.000-15-R; Pin Count: 4; Value: *; Component Type: Standard; Source: S733025T-40.000-15-R.SchLib; Availability: Unavailable; Design Item ID: S733025T-40.000-15-R; Price: None